# Altium schematic sheet NFC_CARD.SchDoc
size 330 x 220 mm; SheetNumber: 1; SheetTotal: 1
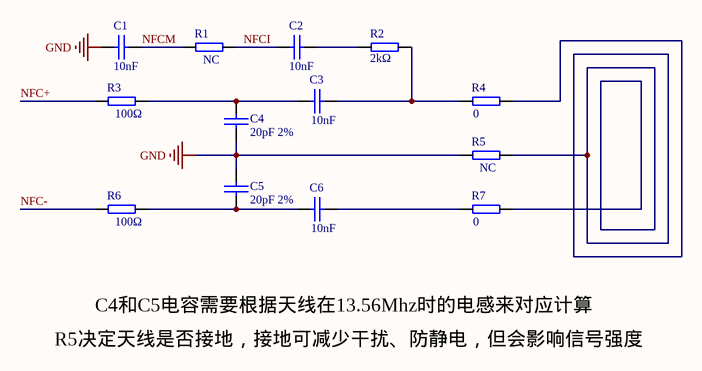
[diagram p0: NFC_CARD.SchDoc]

## Parts
C1  10nF  [0402_C]
C2  10nF  [0402_C]
C3  10nF  [0402_C]
C4  20pF 2%  [0402_C]
C5  20pF 2%  [0402_C]
C6  10nF  [0402_C]
R1  NC  [0402]
R2  2kΩ  [0402]
R3  100Ω  [0402]
R4  0  [0402]
R5  NC  [0402]
R6  100Ω  [0402]
R7  0  [0402]

## Nets
GND: C1.2 C4.1 C5.2 R5.2
NFC+: R3.2
NFC-: R6.2
NFCI: C2.1 R1.1
NFCM: C1.1 R1.2
NetC2_2: C2.2 R2.2
NetC3_1: C3.1 C4.2 R3.1
NetC3_2: C3.2 R2.1 R4.1
NetC5_1: C5.1 C6.1 R6.1
NetC6_2: C6.2 R7.1
NetR4_2: R4.2 R5.1 R7.2

## Notes on the sheet
- R5决定天线是否接地，接地可减少干扰、防静电，但会影响信号强度
- C4和C5电容需要根据天线在13.56Mhz时的电感来对应计算

## Library data of the parts
C1-C6 = CAP: Capacitor
R1-R7 = RES